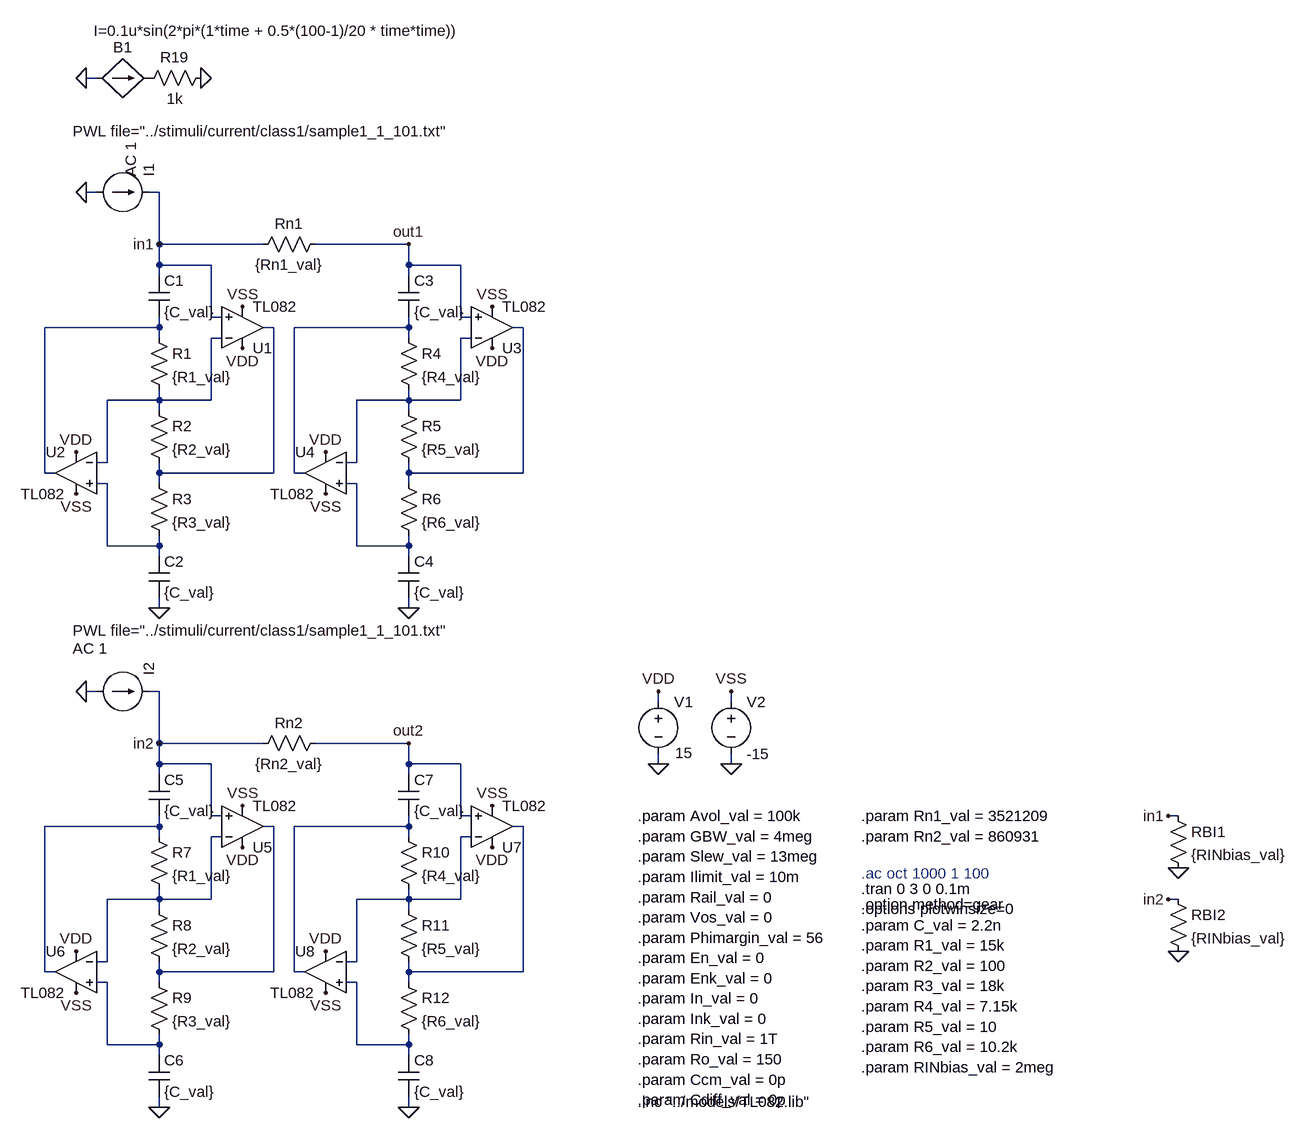
[diagram p0: schematic resonators2.asc]
resonators2.asc, the LTspice schematic file:
Version 4.1
SHEET 1 4328 3364
WIRE -288 -576 -304 -576
WIRE -288 -400 -304 -400
WIRE -192 -400 -208 -400
WIRE -192 -320 -192 -400
WIRE -32 -320 -192 -320
WIRE 192 -320 48 -320
WIRE -192 -288 -192 -320
WIRE -112 -288 -192 -288
WIRE 192 -288 192 -320
WIRE 272 -288 192 -288
WIRE -192 -272 -192 -288
WIRE 192 -272 192 -288
WIRE -112 -208 -112 -288
WIRE -96 -208 -112 -208
WIRE 272 -208 272 -288
WIRE 288 -208 272 -208
WIRE -192 -192 -192 -208
WIRE -192 -192 -368 -192
WIRE -16 -192 -32 -192
WIRE 192 -192 192 -208
WIRE 192 -192 16 -192
WIRE 368 -192 352 -192
WIRE -192 -176 -192 -192
WIRE -96 -176 -112 -176
WIRE 192 -176 192 -192
WIRE 288 -176 272 -176
WIRE -192 -80 -192 -96
WIRE -192 -80 -272 -80
WIRE -112 -80 -112 -176
WIRE -112 -80 -192 -80
WIRE 192 -80 192 -96
WIRE 192 -80 112 -80
WIRE 272 -80 272 -176
WIRE 272 -80 192 -80
WIRE -192 -64 -192 -80
WIRE 192 -64 192 -80
WIRE -272 16 -272 -80
WIRE -272 16 -288 16
WIRE 112 16 112 -80
WIRE 112 16 96 16
WIRE -368 32 -368 -192
WIRE -352 32 -368 32
WIRE -192 32 -192 16
WIRE -16 32 -16 -192
WIRE -16 32 -192 32
WIRE 16 32 16 -192
WIRE 32 32 16 32
WIRE 192 32 192 16
WIRE 368 32 368 -192
WIRE 368 32 192 32
WIRE -272 48 -288 48
WIRE -192 48 -192 32
WIRE 112 48 96 48
WIRE 192 48 192 32
WIRE -272 144 -272 48
WIRE -192 144 -192 128
WIRE -192 144 -272 144
WIRE 112 144 112 48
WIRE 192 144 192 128
WIRE 192 144 112 144
WIRE -192 160 -192 144
WIRE 192 160 192 144
WIRE -192 240 -192 224
WIRE 192 240 192 224
WIRE -288 368 -304 368
WIRE -192 368 -208 368
WIRE 576 384 576 368
WIRE 688 384 688 368
WIRE -192 448 -192 368
WIRE -32 448 -192 448
WIRE 192 448 48 448
WIRE -192 480 -192 448
WIRE -112 480 -192 480
WIRE 192 480 192 448
WIRE 272 480 192 480
WIRE 576 480 576 464
WIRE 688 480 688 464
WIRE -192 496 -192 480
WIRE 192 496 192 480
WIRE -112 560 -112 480
WIRE -96 560 -112 560
WIRE 272 560 272 480
WIRE 288 560 272 560
WIRE 1376 560 1360 560
WIRE -192 576 -192 560
WIRE -192 576 -368 576
WIRE -16 576 -32 576
WIRE 192 576 192 560
WIRE 192 576 16 576
WIRE 368 576 352 576
WIRE -192 592 -192 576
WIRE -96 592 -112 592
WIRE 192 592 192 576
WIRE 288 592 272 592
WIRE -192 688 -192 672
WIRE -192 688 -272 688
WIRE -112 688 -112 592
WIRE -112 688 -192 688
WIRE 192 688 192 672
WIRE 192 688 112 688
WIRE 272 688 272 592
WIRE 272 688 192 688
WIRE 1376 688 1360 688
WIRE -192 704 -192 688
WIRE 192 704 192 688
WIRE -272 784 -272 688
WIRE -272 784 -288 784
WIRE 112 784 112 688
WIRE 112 784 96 784
WIRE -368 800 -368 576
WIRE -352 800 -368 800
WIRE -192 800 -192 784
WIRE -16 800 -16 576
WIRE -16 800 -192 800
WIRE 16 800 16 576
WIRE 32 800 16 800
WIRE 192 800 192 784
WIRE 368 800 368 576
WIRE 368 800 192 800
WIRE -272 816 -288 816
WIRE -192 816 -192 800
WIRE 112 816 96 816
WIRE 192 816 192 800
WIRE -272 912 -272 816
WIRE -192 912 -192 896
WIRE -192 912 -272 912
WIRE 112 912 112 816
WIRE 192 912 192 896
WIRE 192 912 112 912
WIRE -192 928 -192 912
WIRE 192 928 192 912
WIRE -192 1008 -192 992
WIRE 192 1008 192 992
FLAG 576 480 0
FLAG 688 480 0
FLAG 576 368 VDD
FLAG 688 368 VSS
FLAG -192 240 0
FLAG -304 -576 0
FLAG 192 240 0
FLAG -320 0 VDD
FLAG -64 -160 VDD
FLAG 320 -160 VDD
FLAG 64 0 VDD
FLAG -320 64 VSS
FLAG -64 -224 VSS
FLAG 320 -224 VSS
FLAG 64 64 VSS
FLAG -304 -400 0
FLAG -304 368 0
FLAG -192 1008 0
FLAG 192 1008 0
FLAG -320 768 VDD
FLAG -64 608 VDD
FLAG 320 608 VDD
FLAG 64 768 VDD
FLAG -320 832 VSS
FLAG -64 544 VSS
FLAG 320 544 VSS
FLAG 64 832 VSS
FLAG -128 -576 0
FLAG -192 -320 in1
FLAG -192 448 in2
FLAG 192 -320 out1
FLAG 192 448 out2
FLAG 1360 560 in1
FLAG 1376 640 0
FLAG 1360 688 in2
FLAG 1376 768 0
SYMBOL voltage 576 368 R0
WINDOW 123 0 0 Left 0
WINDOW 39 0 0 Left 0
WINDOW 3 26 95 Left 2
SYMATTR Value 15
SYMATTR InstName V1
SYMBOL voltage 688 368 R0
WINDOW 123 0 0 Left 0
WINDOW 39 0 0 Left 0
SYMATTR InstName V2
SYMATTR Value -15
SYMBOL cap -208 -272 R0
SYMATTR InstName C1
SYMATTR Value {C_val}
SYMBOL res -208 -192 R0
SYMATTR InstName R1
SYMATTR Value {R1_val}
SYMBOL res -208 -80 R0
SYMATTR InstName R2
SYMATTR Value {R2_val}
SYMBOL res -208 32 R0
SYMATTR InstName R3
SYMATTR Value {R3_val}
SYMBOL cap -208 160 R0
SYMATTR InstName C2
SYMATTR Value {C_val}
SYMBOL cap 176 -272 R0
SYMATTR InstName C3
SYMATTR Value {C_val}
SYMBOL res 176 -192 R0
SYMATTR InstName R4
SYMATTR Value {R4_val}
SYMBOL res 176 -80 R0
SYMATTR InstName R5
SYMATTR Value {R5_val}
SYMBOL res 176 32 R0
SYMATTR InstName R6
SYMATTR Value {R6_val}
SYMBOL cap 176 160 R0
SYMATTR InstName C4
SYMATTR Value {C_val}
SYMBOL res 64 -336 R90
WINDOW 0 0 56 VBottom 2
WINDOW 3 32 56 VTop 2
SYMATTR InstName Rn1
SYMATTR Value {Rn1_val}
SYMBOL cap -208 496 R0
SYMATTR InstName C5
SYMATTR Value {C_val}
SYMBOL res -208 576 R0
SYMATTR InstName R7
SYMATTR Value {R1_val}
SYMBOL res -208 688 R0
SYMATTR InstName R8
SYMATTR Value {R2_val}
SYMBOL res -208 800 R0
SYMATTR InstName R9
SYMATTR Value {R3_val}
SYMBOL cap -208 928 R0
SYMATTR InstName C6
SYMATTR Value {C_val}
SYMBOL cap 176 496 R0
SYMATTR InstName C7
SYMATTR Value {C_val}
SYMBOL res 176 576 R0
SYMATTR InstName R10
SYMATTR Value {R4_val}
SYMBOL res 176 688 R0
SYMATTR InstName R11
SYMATTR Value {R5_val}
SYMBOL res 176 800 R0
SYMATTR InstName R12
SYMATTR Value {R6_val}
SYMBOL cap 176 928 R0
SYMATTR InstName C8
SYMATTR Value {C_val}
SYMBOL res 64 432 R90
WINDOW 0 0 56 VBottom 2
WINDOW 3 32 56 VTop 2
SYMATTR InstName Rn2
SYMATTR Value {Rn2_val}
SYMBOL res -112 -592 R90
WINDOW 0 0 56 VBottom 2
WINDOW 3 32 56 VTop 2
SYMATTR InstName R19
SYMATTR Value 1k
SYMBOL res 1360 544 R0
SYMATTR InstName RBI1
SYMATTR Value {RINbias_val}
SYMBOL res 1360 672 R0
SYMATTR InstName RBI2
SYMATTR Value {RINbias_val}
SYMBOL OpAmps\\opamp2 -64 -128 M180
SYMATTR InstName U1
SYMATTR Value TL082
SYMBOL OpAmps\\opamp2 -320 -32 M0
SYMATTR InstName U2
SYMATTR Value TL082
SYMBOL OpAmps\\opamp2 320 -128 M180
SYMATTR InstName U3
SYMATTR Value TL082
SYMBOL OpAmps\\opamp2 64 -32 M0
SYMATTR InstName U4
SYMATTR Value TL082
SYMBOL OpAmps\\opamp2 -64 640 M180
SYMATTR InstName U5
SYMATTR Value TL082
SYMBOL OpAmps\\opamp2 -320 736 M0
SYMATTR InstName U6
SYMATTR Value TL082
SYMBOL OpAmps\\opamp2 320 640 M180
SYMATTR InstName U7
SYMATTR Value TL082
SYMBOL OpAmps\\opamp2 64 736 M0
SYMATTR InstName U8
SYMATTR Value TL082
SYMBOL current -288 -400 R270
WINDOW 0 24 80 Left 2
WINDOW 3 94 -37 VRight 2
WINDOW 123 24 52 Left 2
WINDOW 39 0 0 Left 0
SYMATTR InstName I1
SYMATTR Value PWL file="../stimuli/current/class1/sample1_1_101.txt"
SYMATTR Value2 AC 1
SYMBOL bi -288 -576 R270
WINDOW 0 32 40 VTop 2
WINDOW 3 88 278 VBottom 2
SYMATTR InstName B1
SYMATTR Value I=0.1u*sin(2*pi*(1*time + 0.5*(100-1)/20 * time*time))
SYMBOL current -288 368 R270
WINDOW 0 24 80 Left 2
WINDOW 3 94 -37 VRight 2
WINDOW 123 66 -37 VRight 2
WINDOW 39 0 0 Left 0
SYMATTR InstName I2
SYMATTR Value PWL file="../stimuli/current/class1/sample1_1_101.txt"
SYMATTR Value2 AC 1
TEXT 888 648 Left 2 ;.ac oct 1000 1 100
TEXT 888 672 Left 2 !.tran 0 3 0 0.1m\n.options plotwinsize=0
TEXT 888 696 Left 2 !.option method=gear
TEXT 544 560 Left 2 !.param Avol_val = 100k\n.param GBW_val = 4meg\n.param Slew_val = 13meg\n.param Ilimit_val = 10m\n.param Rail_val = 0\n.param Vos_val = 0\n.param Phimargin_val = 56\n.param En_val = 0\n.param Enk_val = 0\n.param In_val = 0\n.param Ink_val = 0\n.param Rin_val = 1T\n.param Ro_val = 150\n.param Ccm_val = 0p\n.param Cdiff_val = 0p
TEXT 888 728 Left 2 !.param C_val = 2.2n\n.param R1_val = 15k\n.param R2_val = 100\n.param R3_val = 18k\n.param R4_val = 7.15k\n.param R5_val = 10\n.param R6_val = 10.2k\n.param RINbias_val = 2meg
TEXT 888 560 Left 2 !.param Rn1_val = 3521209\n.param Rn2_val = 860931
TEXT 544 1000 Left 2 !.inc "../models/TL082.lib"

The netlist it stands for:
* resonators2.asc
V1 VDD 0 15
V2 VSS 0 -15
C1 in1 N001 {C_val}
R1 N001 N005 {R1_val}
R2 N005 N002 {R2_val}
R3 N002 N007 {R3_val}
C2 N007 0 {C_val}
C3 out1 N003 {C_val}
R4 N003 N006 {R4_val}
R5 N006 N004 {R5_val}
R6 N004 N008 {R6_val}
C4 N008 0 {C_val}
Rn1 out1 in1 {Rn1_val}
C5 in2 N009 {C_val}
R7 N009 N013 {R1_val}
R8 N013 N010 {R2_val}
R9 N010 N015 {R3_val}
C6 N015 0 {C_val}
C7 out2 N011 {C_val}
R10 N011 N014 {R4_val}
R11 N014 N012 {R5_val}
R12 N012 N016 {R6_val}
C8 N016 0 {C_val}
Rn2 out2 in2 {Rn2_val}
R19 0 P001 1k
RBI1 in1 0 {RINbias_val}
RBI2 in2 0 {RINbias_val}
X§U1 in1 N005 VDD VSS N002 TL082  ; pins In+ In- V+ V- OUT
X§U2 N007 N005 VDD VSS N001 TL082  ; pins In+ In- V+ V- OUT
X§U3 out1 N006 VDD VSS N004 TL082  ; pins In+ In- V+ V- OUT
X§U4 N008 N006 VDD VSS N003 TL082  ; pins In+ In- V+ V- OUT
X§U5 in2 N013 VDD VSS N010 TL082  ; pins In+ In- V+ V- OUT
X§U6 N015 N013 VDD VSS N009 TL082  ; pins In+ In- V+ V- OUT
X§U7 out2 N014 VDD VSS N012 TL082  ; pins In+ In- V+ V- OUT
X§U8 N016 N014 VDD VSS N011 TL082  ; pins In+ In- V+ V- OUT
I1 0 in1 PWL file="../stimuli/current/class1/sample1_1_101.txt" AC 1
B1 0 P001 I=0.1u*sin(2*pi*(1*time + 0.5*(100-1)/20 * time*time))
I2 0 in2 PWL file="../stimuli/current/class1/sample1_1_101.txt" AC 1
* .ac oct 1000 1 100
.tran 0 3 0 0.1m
.options plotwinsize=0
.option method=gear
.param Avol_val = 100k
.param GBW_val = 4meg
.param Slew_val = 13meg
.param Ilimit_val = 10m
.param Rail_val = 0
.param Vos_val = 0
.param Phimargin_val = 56
.param En_val = 0
.param Enk_val = 0
.param In_val = 0
.param Ink_val = 0
.param Rin_val = 1T
.param Ro_val = 150
.param Ccm_val = 0p
.param Cdiff_val = 0p
.param C_val = 2.2n
.param R1_val = 15k
.param R2_val = 100
.param R3_val = 18k
.param R4_val = 7.15k
.param R5_val = 10
.param R6_val = 10.2k
.param RINbias_val = 2meg
.param Rn1_val = 3521209
.param Rn2_val = 860931
.inc "../models/TL082.lib"
.backanno
.end